# Altium schematic sheet 3V3_Regulators.SchDoc: 3V3 Regulator
size A4; DocumentNumber: 11; SheetNumber: 16; SheetTotal: 17
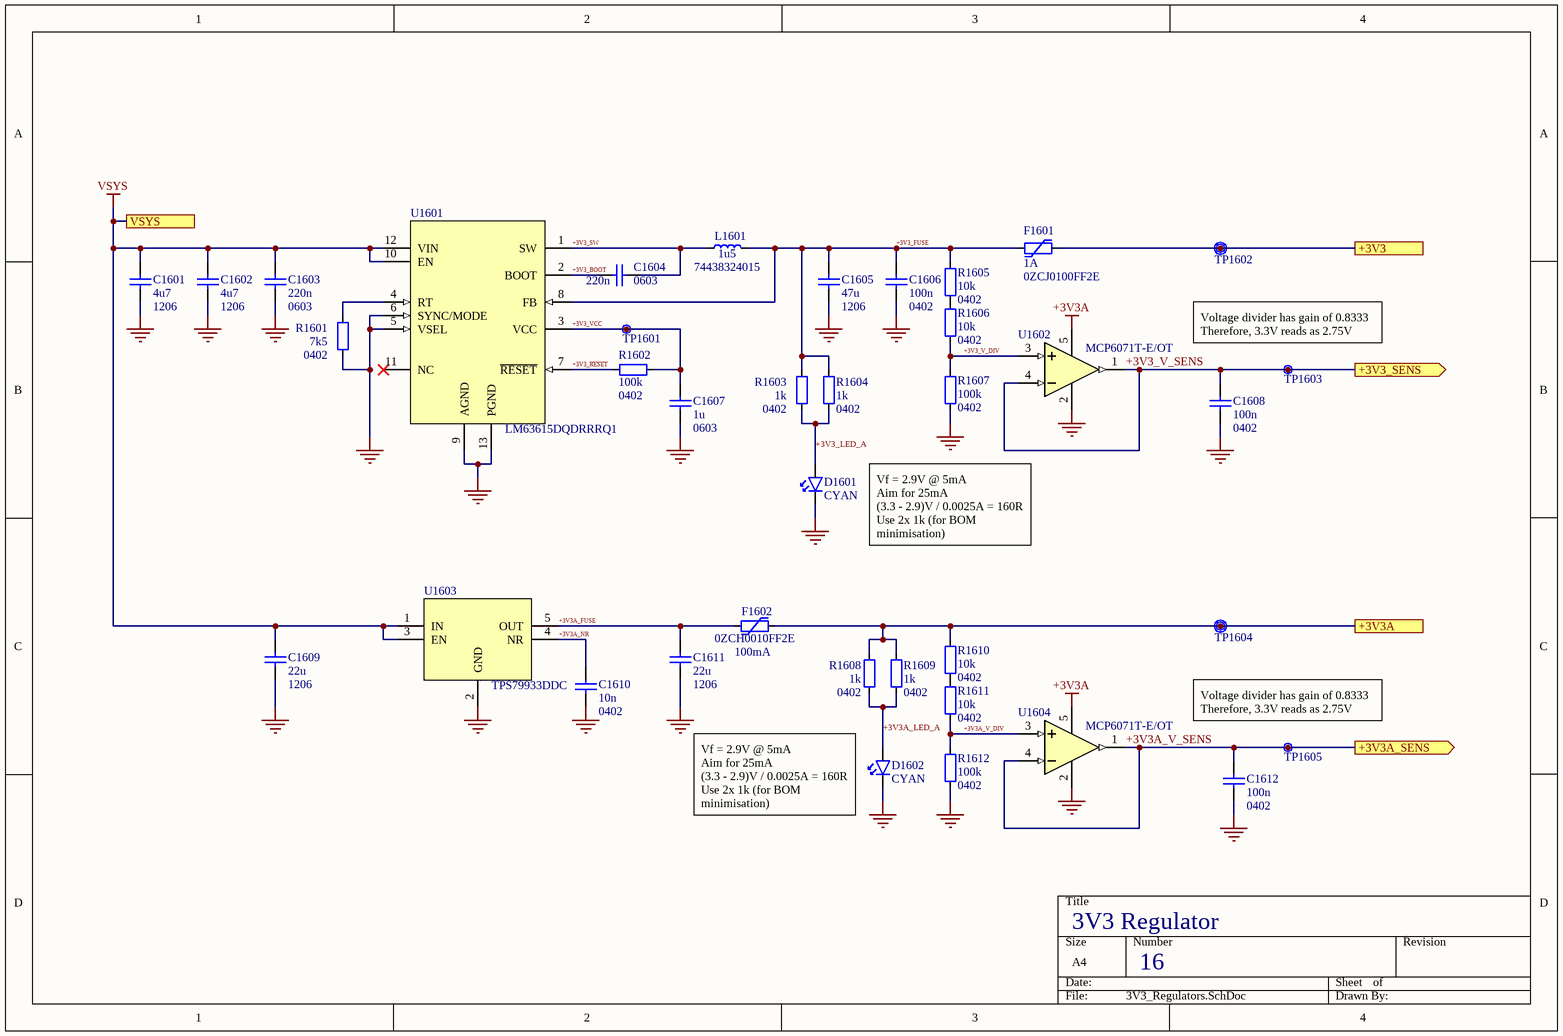
[diagram p0: 3V3_Regulators.SchDoc]

## Parts
C1601  4u7  Footprint: 1206  [CAP_1206_B]
C1602  4u7  Footprint: 1206  [CAP_1206_B]
C1603  220n  Footprint: 0603  [CAP_0603_B]
C1604  220n  Footprint: 0603  [CAP_0603_B]
C1605  47u  Footprint: 1206  [CAP_1206_B]
C1606  100n  Footprint: 0402  [CAP_0402_B]
C1607  1u  Footprint: 0603  [CAP_0603_B]
C1608  100n  Footprint: 0402  [CAP_0402_B]
C1609  22u  Footprint: 1206  [CAP_1206_B]
C1610  10n  Footprint: 0402  [CAP_0402_B]
C1611  22u  Footprint: 1206  [CAP_1206_B]
C1612  100n  Footprint: 0402  [CAP_0402_B]
D1601  CYAN  [SMLD12E3N1WT86]
D1602  CYAN  [SMLD12E3N1WT86]
F1601  1A  [0ZCJ0100FF2E]
F1602  100mA  [0ZCH0010FF2E]
L1601  1u5  [74438324015]
R1601  7k5  Footprint: 0402  [RES_0402_A]
R1602  100k  Footprint: 0402  [RES_0402_A]
R1603  1k  Footprint: 0402  [RES_0402_A]
R1604  1k  Footprint: 0402  [RES_0402_A]
R1605  10k  Footprint: 0402  [RES_0402_A]
R1606  10k  Footprint: 0402  [RES_0402_A]
R1607  100k  Footprint: 0402  [RES_0402_A]
R1608  1k  Footprint: 0402  [RES_0402_A]
R1609  1k  Footprint: 0402  [RES_0402_A]
R1610  10k  Footprint: 0402  [RES_0402_A]
R1611  10k  Footprint: 0402  [RES_0402_A]
R1612  100k  Footprint: 0402  [RES_0402_A]
TP1601  Net  [Unlabelled Testpoint]  (value not drawn)
TP1602  Net  [Labelled Testpoint]  (value not drawn)
TP1603  Net  [Unlabelled Testpoint]  (value not drawn)
TP1604  Net  [Labelled Testpoint]  (value not drawn)
TP1605  Net  [Unlabelled Testpoint]  (value not drawn)
U1601  LM63615DQDRRRQ1  [LM63615DQDRRRQ1]
U1602  MCP6071T-E/OT  [MCP6071T-E/OT]
U1603  TPS79933DDC  [TPS79933DDCR]
U1604  MCP6071T-E/OT  [MCP6071T-E/OT]

## Ports
+3V3 (see Top_Level[4C]), +3V3_SENS (out, see Top_Level[4C], Power_Sense[1C]), +3V3A (see Top_Level[4C]), +3V3A_SENS (out, see Top_Level[4C], Power_Sense[1C]), VSYS (see Top_Level[4C], 5V_Regulator[1B], Battery_Charging[4C])

## Nets
+3V3A: U1602.5(VDD) U1604.5(VDD)
GND: C1601.2 C1602.2 C1603.2 C1605.2 C1606.2 C1607.2 C1608.2 C1609.2 C1610.2 C1611.2 C1612.2 D1601.2 D1602.2 R1601.2(a) R1607.2(a) R1612.2(a) U1601.5(VSEL) U1601.6(SYNC/MODE) U1601.9(AGND) U1601.13(PGND) U1602.2(VSS) U1603.2(GND) U1604.2(VSS)
VSYS: C1601.1 C1602.1 C1603.1 C1609.1 U1601.10(EN) U1601.12(VIN) U1603.1(IN) U1603.3(EN) ; port VSYS
+3V3: F1601.2(a) TP1602.1 ; port +3V3
+3V3_BOOT: C1604.1 U1601.2(BOOT)
+3V3_FUSE: C1605.1 C1606.1 F1601.1(a) L1601.1(a) R1603.1(a) R1604.1(a) R1605.1(a) U1601.8(FB)
+3V3_LED_A: D1601.1 R1603.2(a) R1604.2(a)
+3V3_~{RESET}: R1602.1(a) U1601.7(~{RESET})
+3V3_SW: C1604.2 L1601.2(a) U1601.1(SW)
+3V3_V_DIV: R1606.2(a) R1607.1(a) U1602.3(VIN+)
+3V3_V_SENS: C1608.1 TP1603.1 U1602.1(VOUT) U1602.4(VIN-) ; port +3V3_SENS
+3V3_VCC: C1607.1 R1602.2(a) TP1601.1 U1601.3(VCC)
+3V3A: F1602.2(a) R1608.1(a) R1609.1(a) R1610.1(a) TP1604.1 ; port +3V3A  [a separate net that carries the same name]
+3V3A_FUSE: C1611.1 F1602.1(a) U1603.5(OUT)
+3V3A_LED_A: D1602.1 R1608.2(a) R1609.2(a)
+3V3A_NR: C1610.1 U1603.4(NR)
+3V3A_V_DIV: R1611.2(a) R1612.1(a) U1604.3(VIN+)
+3V3A_V_SENS: C1612.1 TP1605.1 U1604.1(VOUT) U1604.4(VIN-) ; port +3V3A_SENS
NetR1601_1: R1601.1(a) U1601.4(RT)
NetR1605_2: R1605.2(a) R1606.1(a)
NetR1610_2: R1610.2(a) R1611.1(a)

Not connected (* = marked no-connect by the designer): U1601 11(NC)*

## Notes on the sheet
- (near TP1603) Voltage divider has gain of 0.8333
  Therefore, 3.3V reads as 2.75V
- Vf = 2.9V @ 5mA
  Aim for 25mA
  (3.3 - 2.9)V / 0.0025A = 160R
  Use 2x 1k (for BOM minimisation)
- (near TP1605) Voltage divider has gain of 0.8333
  Therefore, 3.3V reads as 2.75V
- (near D1602) Vf = 2.9V @ 5mA
  Aim for 25mA
  (3.3 - 2.9)V / 0.0025A = 160R
  Use 2x 1k (for BOM minimisation)

## Library data of the parts
C1601 C1602 C1605 C1609 C1611 = CAP_1206: 1206 SMD Capacitor
C1603 C1604 C1607 = CAP_0603: 0603 SMD Capacitor
C1606 C1608 C1610 C1612 = CAP_0402: 0402 SMD Capacitor
D1601 D1602 = LED_Generic: Part Number: SMLD12E3N1WT86; Supplier 1: DigiKey; Supplier Part Number 1: SMLD12E3N1WT86CT-ND
F1601 F1602 = FUSE_GENERIC: Generic Fuse Symbol; Supplier 1: Avnet
  F1601: Part Number: 0ZCJ0100FF2E; Supplier Part Number 1: 48AC8418
  F1602: Part Number: 0ZCH0010FF2E; Supplier Part Number 1: 48AC8402
L1601 = IND_GENERIC: Generic inductor symbol; Part Number: 74438324015
R1601-R1612 = RES_0402: 0402 SMD Resistor
TP1601 TP1603 TP1605 = Unlabelled Testpoint: Symbol for an unlabelled testpoint
TP1602 TP1604 = Labelled Testpoint: Symbol for a labelled testpoint
U1601 = LM63615DQDRRRQ1: Buck Switching Regulator IC Positive Adjustable 1V 1 Output 1.5A 12-WFDFN Exposed Pad; Supplier 1: DigiKey; Supplier Part Number 1: 296-LM63615DQDRRRQ1DKR-ND
U1602 U1604 = MCP6071T-E/OT: Standard (General Purpose) Amplifier 1 Circuit Rail-to-Rail SOT-23-5; Supplier 1: Arrow Electronics; Supplier Part Number 1: MCP6071T-E/OT
U1603 = TPS79933DDC: Linear Voltage Regulator IC Positive Fixed 1 Output 200mA SOT-23-THIN; Supplier 1: DigiKey; Supplier Part Number 1: 296-17783-6-ND